# Altium schematic sheet Power_Section.SchDoc
size A; DocumentNumber: 2; SheetNumber: 2; SheetTotal: 4
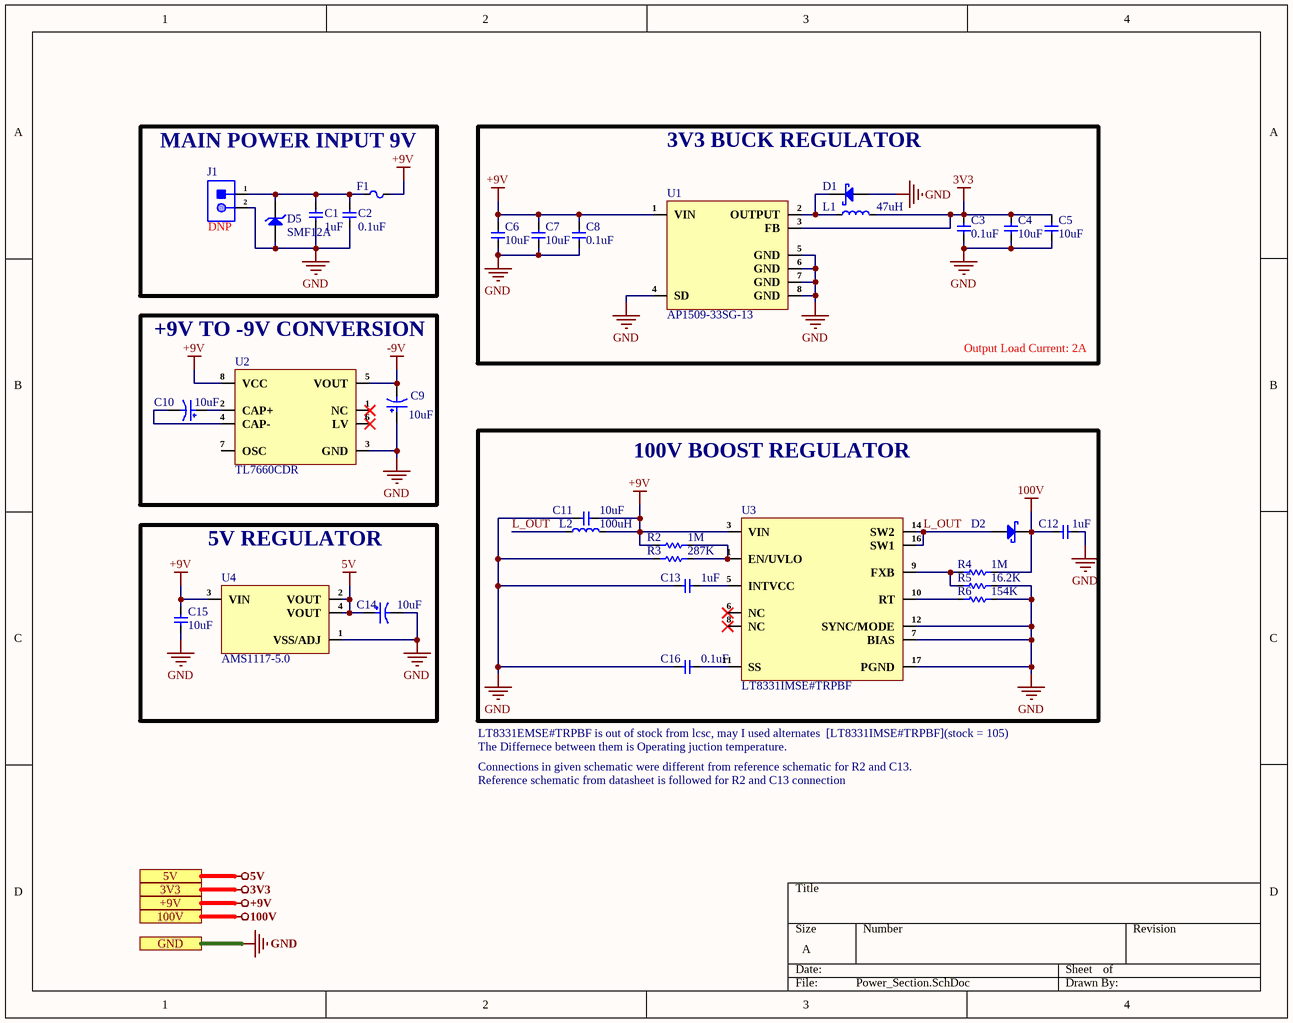
[diagram p0: Power_Section.SchDoc]

## Parts
C1  1uF  [CAP-0201]
C2  0.1uF  [CAP-0201]
C3  0.1uF  [CAP-0201]
C4  10uF  [Cap-0603]
C5  10uF  [Cap-0603]
C6  10uF  [Cap-0603]
C7  10uF  [Cap-0603]
C8  0.1uF  [CAP-0201]
C9  10uF  [Case-B]
C10  10uF  [Case-B]
C11  10uF  [Cap-0603]
C12  1uF  [Cap-1812]
C13  1uF  [CAP-0201]
C14  10uF  [Case-B]
C15  10uF  [Cap-0603]
C16  0.1uF  [CAP-0201]
D1  B340A  [SMA(DO-214AC)]  (value not drawn)
D2  RB558VAM150TR  [SOD-323HE]  (value not drawn)
D5  SMF12A  [SOD-123F]
F1  SMD2018-200  [SMD2018-200]  (value not drawn)
J1  X6521WVS-2x01H-C60D74  [X6521WVS-2x01H-C60D74]  (value not drawn)
L1  47uH  [SMMS1050-470M]
L2  100uH  [SDR1307A-101K]
R2  1M  [Res-0402]
R3  287K  [Res-0201]
R4  1M  [Res-0402]
R5  16.2K  [Res-0201]
R6  154K  [Res-0201]
U1  AP1509-33SG-13  [SOP-8L]
U2  TL7660CDR  [SOIC-8(0.154", 3.90mm Width)]
U3  LT8331IMSE#TRPBF  [16-MSOP-EP]
U4  AMS1117-5.0  [SOT- 223]

## Blocks framed on the sheet
MAIN POWER INPUT 9V: C1 C2 D5 F1 J1
3V3 BUCK REGULATOR: C3-C8 D1 L1 U1
+9V TO -9V CONVERSION: C9 C10 U2
100V BOOST REGULATOR: C11-C13 C16 D2 L2 R2-R6 U3
5V REGULATOR: C14 C15 U4

## Ports
3V3 (see Top_sheet[1B], Controller_Section[4D]), 5V (see Top_sheet[1B], Controller_Section[4D], Transmitter_Receiver_Section[2D]), 100V (see Top_sheet[1B], Transmitter_Receiver_Section[2D]), +9V (see Top_sheet[1B], Transmitter_Receiver_Section[2D]), GND (see Top_sheet[2C], Controller_Section[4D], Transmitter_Receiver_Section[2D])

## Nets
3V3: C3.2 C4.2 C5.2 L1.2 U1.3(FB) ; port 3V3
5V: C14.1 U4.2(VOUT) U4.4(VOUT) ; port 5V
100V: C12.2 D2.1(K) R4.2 ; port 100V
+9V: C6.2 C7.2 C8.2 C11.1 C15.2 F1.2 L2.2 R2.1 U1.1(VIN) U2.8(VCC) U3.3(VIN) U4.3(VIN) ; port +9V
-9V: C9.2 U2.5(VOUT)
GND: C1.1 C2.1 C3.1 C4.1 C5.1 C6.1 C7.1 C8.1 C9.1 C11.2 C12.1 C13.2 C14.2 C15.1 C16.2 D1.2(A) D5.2(A) J1.2 R3.1 R5.2 R6.2 U1.4(SD) U1.5(GND) U1.6(GND) U1.7(GND) U1.8(GND) U2.3(GND) U3.7(BIAS) U3.12(SYNC/MODE) U3.17(PGND) U4.1(VSS/ADJ) ; port GND
L_OUT: D2.2(A) L2.1 U3.14(SW2) U3.16(SW1)
NetC1_2: C1.2 C2.2 D5.1(K) F1.1 J1.1
NetC10_1: C10.1 U2.2(CAP+)
NetC10_2: C10.2 U2.4(CAP-)
NetC13_1: C13.1 U3.5(INTVCC)
NetC16_1: C16.1 U3.11(SS)
NetD1_1: D1.1(K) L1.1 U1.2(OUTPUT)
NetR2_2: R2.2 R3.2 U3.1(EN/UVLO)
NetR4_1: R4.1 R5.1 U3.9(FXB)
NetR6_1: R6.1 U3.10(RT)

Not connected (* = marked no-connect by the designer): U2 1(NC)* 6(LV)* 7(OSC); U3 6(NC)* 8(NC)*

## Notes on the sheet
- (near J1) DNP
- Output Load Current: 2A
- LT8331EMSE#TRPBF is out of stock from lcsc, may I used alternates  [LT8331IMSE#TRPBF](stock = 105)
- The Differnece between them is Operating juction temperature.
- Connections in given schematic were different from reference schematic for R2 and C13.
- Reference schematic from datasheet is followed for R2 and C13 connection

## Library data of the parts
C1 C13 = GRM033R61C105ME15D: CAP CER 1UF 16V X5R 0201; Manufacturer: Murata; Item Type: Capacitor; Supplier 1: Digi-Key; Manufacturer Part Number: GRM033R61C105ME15D; RoHS: No; Category: Ceramic Capacitors; Stock 1: 12823; Pricing 1: 1=0.14, 10=0.098, 50=0.0554, 100=0.0459, 500=0.0322, 1000=0.02665, 2500=0.02481, 5000=0.0227 (USD); ComponentLink1URL: https://datasheet.octopart.com/GRM033R61C105ME15D-Murata-datasheet-155345049.pdf?src-supplier=Element14; ComponentLink1Description: https://datasheet.octopart.com/GRM033R61C105ME15D-Murata-datasheet-155345049.pdf?src-supplier=Element14; ComponentLink2URL: https://datasheet.octopart.com/GRM033R61C105ME15D-Murata-datasheet-165579666.pdf?src-supplier=TME; ComponentLink2Description: https://datasheet.octopart.com/GRM033R61C105ME15D-Murata-datasheet-165579666.pdf?src-supplier=TME; LCSC Part Number: C335102; Supplier Part Number 1: 490-18654-1-ND
C2 C3 C8 C16 = GRM033R61E104KE14D: CAP CER 0.1UF 25V X5R 0201; Manufacturer: Murata; Material: 4241ConductorMaterial; Value: 100nF; Tolerance: 10%; Item Type: Capacitor; Supplier: Rs; Supplier Part Number: 1852066; Manufacturer Part Number: GRM033R61E104KE14D; RoHS: Yes; Category: Ceramic Capacitors; Stock: 14000; Pricing: 1000=0.008, 5000=0.007, 10000=0.006 (GBP); Mounting Technology: Surface Mount; Case/Package: 0201; Case Code (Metric): 0603; Case Code (Imperial): 0201; Weight: 1.2E-05oz; Min Operating Temperature: -55°C; Max Operating Temperature: 85°C; Packaging: Tape and Reel; Voltage Rating: 25V; Dielectric: X5R; Termination: SMD/SMT; Voltage Rating (DC): 25V; Package Quantity: 15000; Series: GRM; Length: 0.024inch; Width: 0.012inch; Height: 0.3mm; Thickness: 0.013inch; Lead Free: Lead Free; RoHS Compliant: Yes; ComponentLink1URL: http://www.farnell.com/datasheets/2867843.pdf?src-supplier=Farnell; ComponentLink1Description: http://www.farnell.com/datasheets/2867843.pdf?src-supplier=Farnell; ComponentLink2URL: http://www.mouser.com/ds/2/281/c02e-2905.pdf?src-supplier=Mouser; ComponentLink2Description: http://www.mouser.com/ds/2/281/c02e-2905.pdf?src-supplier=Mouser; ComponentLink3URL: https://datasheet.octopart.com/GRM033R61E104KE14D-Murata-datasheet-22122223.pdf?src-supplier=Future+Electronics; ComponentLink3Description: https://datasheet.octopart.com/GRM033R61E104KE14D-Murata-datasheet-22122223.pdf?src-supplier=Future+Electronics; ComponentLink4URL: http://www.farnell.com/datasheets/2867843.pdf?src-supplier=Element14; ComponentLink4Description: http://www.farnell.com/datasheets/2867843.pdf?src-supplier=Element14; ComponentLink5URL: http://search.murata.co.jp/Ceramy/image/img/A01X/G101/ENG/GRM033R61E104KE14-01.pdf?src-supplier=Digi-Key; ComponentLink5Description: http://search.murata.co.jp/Ceramy/image/img/A01X/G101/ENG/GRM033R61E104KE14-01.pdf?src-supplier=Digi-Key; ComponentLink6URL: http://www.farnell.com/datasheets/2867843.pdf?src-supplier=Newark; ComponentLink6Description: http://www.farnell.com/datasheets/2867843.pdf?src-supplier=Newark; ComponentLink7URL: https://datasheet.octopart.com/GRM033R61E104KE14D-Murata-datasheet-165579666.pdf?src-supplier=TME; ComponentLink7Description: https://datasheet.octopart.com/GRM033R61E104KE14D-Murata-datasheet-165579666.pdf?src-supplier=TME; LCSC Part Number: C76939
C4-C7 C11 C15 = GRM188R6YA106MA73D: 10uF 35V X5R 20% Pad SMD 0603; Manufacturer: Murata; Supplier 1: Arrow Electronics; Manufacturer Part Number: GRM188R6YA106MA73D; RoHS: Yes; Category: Ceramic Capacitors; Stock 1: 37601; Pricing 1: 1=0.36650, 10=0.23380, 25=0.23160, 100=0.15050, 250=0.14890, 500=0.10700, 1000=0.09270, 3000=0.08640, 6000=0.07720, 15000=0.07140, 30000=0.05840 (USD); Mount: Surface Mount; Case/Package: 0603; Case Code (Metric): 1608; Case Code (Imperial): 0603; Min Operating Temperature: -55°C; Max Operating Temperature: 85°C; Packaging: Tape and Reel; Capacitance: 10uF; Voltage Rating: 35V; Tolerance: 20%; Voltage Rating (DC): 35V; Dielectric: X5R; Length: 0.063inch; Width: 0.031inch; Thickness: 0.039inch; RoHS Compliant: Yes; ComponentLink1URL: http://search.murata.co.jp/Ceramy/image/img/A01X/G101/ENG/GRM188R6YA106MA73-01.pdf?src-supplier=Future+Electronics; ComponentLink1Description: http://search.murata.co.jp/Ceramy/image/img/A01X/G101/ENG/GRM188R6YA106MA73-01.pdf?src-supplier=Future+Electronics; ComponentLink2URL: http://search.murata.co.jp/Ceramy/image/img/A01X/G101/ENG/GRM188R6YA106MA73-01.pdf?src-supplier=Digi-Key; ComponentLink2Description: http://search.murata.co.jp/Ceramy/image/img/A01X/G101/ENG/GRM188R6YA106MA73-01.pdf?src-supplier=Digi-Key; ComponentLink3URL: https://www.murata.com/~/media/webrenewal/support/library/catalog/products/capacitor/mlcc/c02e.ashx?la=en-us&src-supplier=Digi-Key; ComponentLink3Description: https://www.murata.com/~/media/webrenewal/support/library/catalog/products/capacitor/mlcc/c02e.ashx?la=en-us&src-supplier=Digi-Key; ComponentLink4URL: http://search.murata.co.jp/Ceramy/image/img/A01X/G101/ENG/GRM188R6YA106MA73-01.pdf?src-supplier=Mouser; ComponentLink4Description: http://search.murata.co.jp/Ceramy/image/img/A01X/G101/ENG/GRM188R6YA106MA73-01.pdf?src-supplier=Mouser; ComponentLink5URL: http://search.murata.co.jp/Ceramy/image/img/A01X/G101/ENG/GRM188R6YA106MA73-01.pdf?src-supplier=TTI; ComponentLink5Description: http://search.murata.co.jp/Ceramy/image/img/A01X/G101/ENG/GRM188R6YA106MA73-01.pdf?src-supplier=TTI; Supplier Part Number 1: GRM188R6YA106MA73D; LCSC Part Number: C194427
C9 C10 C14 = CA45-B025K106T: 10uF 25V 2.5Ω@100kHz ±10% CASE-B-3528 Tantalum Capacitors ROHS; Manufacturer: Xiangyee in S&T; Manufacturer Part Number: CA45-B025K106T; ComponentLink1URL: https://www.lcsc.com/product-detail/Tantalum-Capacitors_Hunan-Xiangyee-in-S-T-CA45-B025K106T_C119050.html; ComponentLink1Description: LCSC; LCSC Part Number: C119050; Item Type: Capacitor; Package: Case-B
C12 = FS43X105K251EGG: 250V 1uF X7R ±10% 1812 Multilayer Ceramic Capacitors MLCC - SMD/SMT ROHS; Manufacturer: PSA; Manufacturer Part Number: FS43X105K251EGG; Package: 1812; LCSC Part Number: C381468; Item Type: Capacitor; ComponentLink1Description: LCSC; ComponentLink1URL: https://www.lcsc.com/product-detail/Multilayer-Ceramic-Capacitors-MLCC-SMD-SMT_PSA-Prosperity-Dielectrics-FS43X105K251EGG_C381468.html
D1 = B340A: 40V 3A 550mV@3A SMA(DO-214AC) Schottky Barrier Diodes (SBD) ROHS; Manufacturer: FUXINSEMI; Item Type: Diode; Manufacturer Part Number: B340A; Package: SMA(DO-214AC); LCSC Part Number: C3018525; ComponentLink1Description: LCSC; ComponentLink1URL: https://www.lcsc.com/product-detail/Schottky-Barrier-Diodes-SBD_FUXINSEMI-B340A_C3018525.html
D2 = RB558VAM150TR: Diode Schottky 150V 500mA 2-Pin SOD-323HE Emboss T/R; Manufacturer: Rohm; Item Type: Schottky Barrier Diodes; Supplier: Digi-Key; Supplier Part Number: 846-RB558VAM150TR-ND; Manufacturer Part Number: RB558VAM150TR; RoHS: Yes; Category: Schottky Diodes; Stock: 30000; Pricing: 3000=0.07231, 6000=0.06914, 9000=0.05979, 30000=0.05867, 75000=0.04858, 150000=0.04783 (USD); Mounting Technology: Surface Mount; Case/Package: SMD/SMT; Series: *; Average Rectified Current: 500mA; Max Reverse Voltage (DC): 150V; RoHS Compliant: Yes; LCSC Part Number: C5336764
D5 = SMF12A: 10.1A 200W 19.9V 13.3V 12V SOD-123F Electrostatic and Surge Protection (TVS/ESD) ROHS; Manufacturer: Shandong Jingdao Microelectronics; Item Type: Diode; LCSC Part Number: C178259; Manufacturer Part Number: SMF12A; Package: SOD-123F; ComponentLink7Description: LCSC; ComponentLink7URL: https://www.lcsc.com/product-detail/TVS_AnBon-SMBJ5-0A_C440263.html
F1 = SMD2018-200: 10V 2A 100A 4A 2018 Resettable Fuses ROHS; Manufacturer: Tech Fuse; Item type: Fuse; ComponentLink1Description: LCSC; ComponentLink1URL: https://www.lcsc.com/product-detail/Resettable-Fuses_TECHFUSE-SMD2018-200_C70152.html; Manufacturer Part Number: SMD2018-200; Package: 2018; LCSC Part Number: C70152
J1 = X6521WVS-2x01H-C60D74: Gold 250V 3A Brick nogging Square Pins 2.5mm 2P 260℃ 6mm -40℃~+105℃ 2.54mm 双排 Black Brass 2x1P SMD,P=2.54mm Pin Headers ROHS; Manufacturer: XKB Connectivity; Item Type: Connector; Manufacturer Part Number: X6521WVS-2x01H-C60D74; Package: SMD,P=2.54mm; LCSC Part Number: C2884014; ComponentLink1Description: LCSC; ComponentLink1URL: https://www.lcsc.com/product-detail/Pin-Headers_XKB-Connectivity-X6521WVS-2x01H-C60D74_C2884014.html
L1 = SMMS1050-470M: 3A 47uH Molding Choke ±20% 4.5A SMD Power Inductors ROHS; Manufacturer: SXN; Footprint: SMD; Manufacturer Part Number: SMMS1050-470M; Value: 47uH; LCSC Part Number: C149548; ComponentLink1Description: LCSC; ComponentLink1URL: https://www.lcsc.com/product-detail/Power-Inductors_SXN-Shun-Xiang-Nuo-Elec-SMMS1050-470M_C149548.html
L2 = SDR1307A-101K: Ind Power Unshielded Wirewound 100uH 10% 100KHz 25Q-Factor Ferrite 1.9A T/R; Manufacturer: Bourns; Item Type: Inductor; Supplier: Digi-Key; Supplier Part Number: SDR1307A-101KCT-ND; Manufacturer Part Number: SDR1307A-101K; RoHS: Yes; Category: Fixed Inductors; Stock: 2952; Pricing: 1=1.16, 10=0.982, 25=0.8928, 50=0.8392, 100=0.6964 (USD); ComponentLink1URL: https://datasheet.ciiva.com/46435/1778094-46435133.pdf?src-supplier=Element14; ComponentLink1Description: https://datasheet.ciiva.com/46435/1778094-46435133.pdf?src-supplier=Element14; LCSC Part Number: C2042930; ComponentLink2Description: LCSC; ComponentLink2URL: https://www.lcsc.com/product-detail/Power-Inductors_BOURNS-SDR1307A-101K_C2042930.html
R2 R4 = WF04H1004DTL: 125mW ±100ppm/℃ ±0.5% 1MΩ 0402 Chip Resistor - Surface Mount ROHS; Manuacturer: Walsin Tech Crop; Manufacturer Part Number: WF04H1004DTL; Package: 0402; Value: 1M; LCSC Part Number: C305257; ComponentLink1Description: LCSC; ComponentLink1URL: https://www.lcsc.com/product-detail/Chip-Resistor-Surface-Mount_Walsin-Tech-Corp-WF04H1004DTL_C305257.html
R3 = RC0201FR-07287KL: SMD Chip Resistor, 287 kOhm, ± 1%, 50 mW, 0201 [0603 Metric], Thick Film, General Purpose; Manufacturer: YAGEO; Value: 287kR; Max Power Dissipation: 50mW; Temperature Coefficient: 200ppm/°C; Voltage Rating: 25V; Manufacturer Part Number: RC0201FR-07287KL; LCSC Part Number: C474636; Item Type: Resistor; Package: 0201; ComponentLink1Description: LCSC; ComponentLink1URL: https://www.lcsc.com/product-detail/Chip-Resistor-Surface-Mount_YAGEO-RC0201FR-07287KL_C474636.html; Supplier: Arrow Electronics; Supplier Part Number: RC0201FR-07287KL; RoHS: Yes; Category: Chip SMD Resistors; Stock: 19914; Pricing: 1=0.057, 10=0.0097, 25=0.0092, 100=0.0057, 250=0.0056, 500=0.0054, 1000=0.0034, 3000=0.0032, 6000=0.0023 (USD); Case/Package: 0201; Case Code (Metric): 0603; Case Code (Imperial): 0201; Min Operating Temperature: -55°C; Max Operating Temperature: 125°C; Packaging: Cut Tape; Number of Terminations: 2; Tolerance: 1%; Features: Moisture Resistant; Series: RC; Length: 0.024inch; Width: 0.012inch; Height: 0.01inch; RoHS Compliant: Yes; ComponentLink2URL: http://www.yageo.com/documents/recent/PYu-RC_Group_51_RoHS_L_9.pdf?src-supplier=Digi-Key; ComponentLink2Description: http://www.yageo.com/documents/recent/PYu-RC_Group_51_RoHS_L_9.pdf?src-supplier=Digi-Key; ComponentLink3URL: https://www.yageo.com/upload/media/product/productsearch/datasheet/rchip/PYu-RC_Group_51_RoHS_L_11.pdf?src-supplier=Digi-Key; ComponentLink3Description: https://www.yageo.com/upload/media/product/productsearch/datasheet/rchip/PYu-RC_Group_51_RoHS_L_11.pdf?src-supplier=Digi-Key
R5 = RTT011622FTH: 50mW Thick Film Resistors 25V ±1% ±200ppm/℃ 16.2kΩ 0201 Chip Resistor - Surface Mount ROHS; Manufacturer: RALEC; Manufacturer Part Number: RTT011622FTH; Package: 0201; LCSC Part Number: C166338; Item Type: Resistor; ComponentLink1Description: LCSC; ComponentLink1URL: https://www.lcsc.com/product-detail/Chip-Resistor-Surface-Mount_RALEC-RTT011622FTH_C166338.html
R6 = RC0201FR-07154KL: Res Thick Film 0201 154K Ohm 1% 1/20W ±200ppm/°C Molded SMD Paper T/R; Manufacturer: YAGEO; Item Type: Resistor; Value: 154kR; Max Power Dissipation: 50mW; Manufacturer Part Number: RC0201FR-07154KL; Package: 0201; ComponentLink1Description: LCSC; ComponentLink1URL: https://www.lcsc.com/product-detail/Chip-Resistor-Surface-Mount_YAGEO-RC0201FR-07154KL_C474540.html; LCSC Part Number: C474540; Supplier: Future Electronics; Supplier Part Number: 3110231; RoHS: Yes; Category: Chip SMD Resistors; Stock: 110000; Pricing: 10000=0.0014, 50000=0.0013, 250000=0.0013, 750000=0.0012, 2000000=0.0011 (USD); Case/Package: 0201; Case Code (Metric): 0603; Case Code (Imperial): 0201; Min Operating Temperature: -55°C; Max Operating Temperature: 125°C; Packaging: Cut Tape; Number of Terminations: 2; Tolerance: 1%; Temperature Coefficient: 200ppm/°C; Features: Moisture Resistant; Series: RC; Length: 0.024inch; Width: 0.012inch; Height: 0.01inch; RoHS Compliant: Yes; ComponentLink2URL: http://www.yageo.com/documents/recent/PYu-RC_Group_51_RoHS_L_9.pdf?src-supplier=Digi-Key; ComponentLink2Description: http://www.yageo.com/documents/recent/PYu-RC_Group_51_RoHS_L_9.pdf?src-supplier=Digi-Key; ComponentLink3URL: https://www.yageo.com/upload/media/product/productsearch/datasheet/rchip/PYu-RC_Group_51_RoHS_L_11.pdf?src-supplier=Digi-Key; ComponentLink3Description: https://www.yageo.com/upload/media/product/productsearch/datasheet/rchip/PYu-RC_Group_51_RoHS_L_11.pdf?src-supplier=Digi-Key; ComponentLink4URL: http://www.yageo.com.tw/exep/pages/download/literatures/PYu-R_INT-thick_7.pdf?src-supplier=Digi-Key; ComponentLink4Description: http://www.yageo.com.tw/exep/pages/download/literatures/PYu-R_INT-thick_7.pdf?src-supplier=Digi-Key
U1 = AP1509-33SG-13: IC REG BUCK 3.3V 2A 8SOIC; Manufacturer: Diodes; Item Type: Regulator; Supplier: Digi-Key; Supplier Part Number: AP1509-33SGDICT-ND; Manufacturer Part Number: AP1509-33SG-13; RoHS: Yes; Category: Voltage Regulators - Switching; Stock: 7160; Pricing: 1=1.6, 10=1.43, 25=1.3576, 100=1.115, 250=1.04232, 500=0.92112, 1000=0.7272 (USD); ComponentLink1URL: https://datasheet.ciiva.com/2024/ap1509-2024112.pdf?src-supplier=Digi-Key; ComponentLink1Description: https://datasheet.ciiva.com/2024/ap1509-2024112.pdf?src-supplier=Digi-Key; ComponentLink2URL: https://datasheet.ciiva.com/22696/608784-22696879.pdf?src-supplier=Element14; ComponentLink2Description: https://datasheet.ciiva.com/22696/608784-22696879.pdf?src-supplier=Element14; ComponentLink3URL: https://datasheet.ciiva.com/3220/ap1509-3220415.pdf?src-supplier=Avnet; ComponentLink3Description: https://datasheet.ciiva.com/3220/ap1509-3220415.pdf?src-supplier=Avnet; ComponentLink4URL: https://datasheet.ciiva.com/3222/ap1509-3222047.pdf?src-supplier=Avnet; ComponentLink4Description: https://datasheet.ciiva.com/3222/ap1509-3222047.pdf?src-supplier=Avnet; ComponentLink5URL: https://datasheet.ciiva.com/1161/608784-1161659.pdf?src-supplier=Element14; ComponentLink5Description: https://datasheet.ciiva.com/1161/608784-1161659.pdf?src-supplier=Element14; LCSC Part no: C151823
U2 = TL7660CDR: Charge Pump INV/STPUP/STPDN -1.5V to -10V 100mA 8-Pin SOIC T/R / IC REG SWITCHD CAP INV 8SOIC; Manufacturer: Texas Instruments; Supplier: Digi-Key; Supplier Part Number: 296-21856-1-ND; Manufacturer Part Number: TL7660CDR; RoHS: Yes; Category: Voltage Regulators - Switching; Stock: 5011; Pricing: 1=1.15, 10=1.024, 25=0.9716, 100=0.798, 250=0.746, 500=0.65926, 1000=0.52046 (USD); ComponentLink1URL: https://datasheet.ciiva.com/15114/getdatasheetpartid-314156-15114111.pdf?src-supplier=Verical; ComponentLink1Description: https://datasheet.ciiva.com/15114/getdatasheetpartid-314156-15114111.pdf?src-supplier=Verical; ComponentLink2URL: https://datasheet.ciiva.com/2033/tl7660-2033856.pdf?src-supplier=Digi-Key; ComponentLink2Description: https://datasheet.ciiva.com/2033/tl7660-2033856.pdf?src-supplier=Digi-Key; ComponentLink3URL: https://datasheet.ciiva.com/41462/001014582-da-01-en-ic-reg-multi-config-tl7660cdr-soic-8-tid-41462430.pdf?src-supplier=Conrad; ComponentLink3Description: https://datasheet.ciiva.com/41462/001014582-da-01-en-ic-reg-multi-config-tl7660cdr-soic-8-tid-41462430.pdf?src-supplier=Conrad; ComponentLink4URL: https://datasheet.ciiva.com/3216/tl7660-3216343.pdf?src-supplier=Avnet; ComponentLink4Description: https://datasheet.ciiva.com/3216/tl7660-3216343.pdf?src-supplier=Avnet; ComponentLink5URL: https://datasheet.ciiva.com/2033/tl7660-2033857.pdf?src-supplier=Digi-Key; ComponentLink5Description: https://datasheet.ciiva.com/2033/tl7660-2033857.pdf?src-supplier=Digi-Key; ComponentLink6URL: https://datasheet.ciiva.com/2033/tl7660-2033858.pdf?src-supplier=Digi-Key; ComponentLink6Description: https://datasheet.ciiva.com/2033/tl7660-2033858.pdf?src-supplier=Digi-Key; LCSC Part Number: C130206; Item Type: IC
U3 = LT8331IMSE#TRPBF: IC REG MULTI CONFG ADJ 16MSOP; Manufacturer: Analog Devices; Manufacturer Part Number: LT8331IMSE#TRPBF; Package: MSOP-12; LCSC Part Number: C673751; ComponentLink1Description: LCSC; ComponentLink1URL: https://www.lcsc.com/product-detail/DC-DC-Converters_Analog-Devices-LT8331IMSE-TRPBF_C673751.html; Item Type: IC
U4 = AMS1117-5.0: SOT-223 Linear Voltage Regulators (LDO) ROHS; Manufacturer: HX(hengjiaxing); Item Type: IC; Manufacturer Part Number: AMS1117-5.0; Package: SOT-223; LCSC Part Number: C5181462; ComponentLink1Description: LCSC; ComponentLink1URL: https://www.lcsc.com/product-detail/Linear-Voltage-Regulators-LDO_HX-hengjiaxing-AMS1117-5-0_C5181462.html